# Altium schematic sheet SPARC_v3.SchDoc
size A4; SheetNumber: 1; SheetTotal: 1
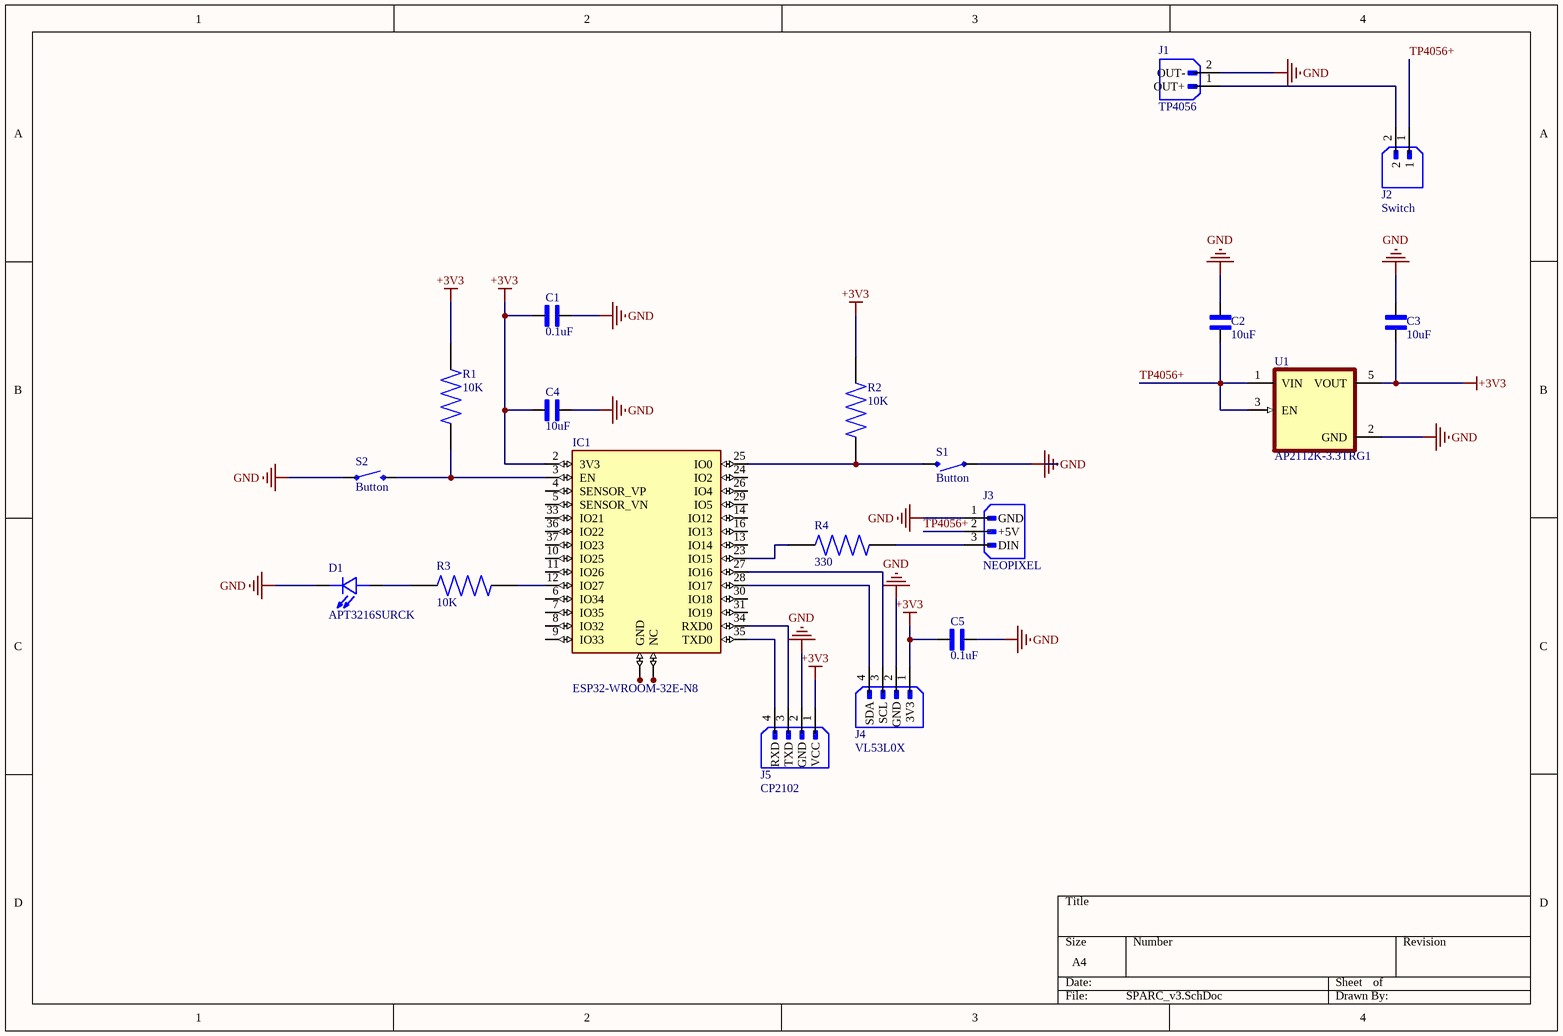
[diagram p0: SPARC_v3.SchDoc]

## Parts
C1  0.1uF  [CAPC3216X110N]
C2  10uF  [CAPC3216X110N]
C3  10uF  [CAPC3216X110N]
C4  10uF  [CAPC3216X110N]
C5  0.1uF  [CAPC3216X110N]
D1  APT3216SURCK  [LED_APT3216SURCK]
IC1  ESP32-WROOM-32E-N8  [ESP32WROOM32EN8]
J1  TP4056  [JST_B2B-XH-A]
J2  Switch  [JST_B2B-XH-A]
J3  NEOPIXEL  [JST_B3B-XH-A]
J4  VL53L0X  [JST_B4B-XH-A]
J5  CP2102  [JST_B4B-XH-A]
R1  10K  [RES_ERJP08D8251V]
R2  10K  [RES_ERJP08D8251V]
R3  10K  [RES_ERJP08D8251V]
R4  330  [RES_ERJP08D8251V]
S1  Button  [TACTILE_SWITCH_SMD_6.0X3.5MM]
S2  Button  [TACTILE_SWITCH_SMD_6.0X3.5MM]
U1  AP2112K-3.3TRG1  [SOT95P285X140-5N]

## Nets
+3V3: C1.2 C3.2 C4.2 C5.2 IC1.2(3V3) J4.1(3V3) J5.1(VCC) R1.2 R2.2 U1.5(VOUT)
GND: C1.1 C2.1 C3.1 C4.1 C5.1 D1.1(C) J1.2(OUT-) J3.1(GND) J4.2(GND) J5.2(GND) S1.1 S2.1 U1.2(GND)
TP4056+: C2.2 J2.1 J3.2(+5V) U1.1(VIN) U1.3(EN)
NetD1_2: D1.2(A) R3.1
NetIC1_1: IC1.1(GND) IC1.15(GND) IC1.38(GND) IC1.39(GND) IC1.40(GND) IC1.41(GND) IC1.42(GND) IC1.43(GND) IC1.44(GND) IC1.45(GND) IC1.46(GND) IC1.47(GND)
NetIC1_3: IC1.3(EN) R1.1 S2.2
NetIC1_12: IC1.12(IO27) R3.2
NetIC1_17: IC1.17(NC) IC1.18(NC) IC1.19(NC) IC1.20(NC) IC1.21(NC) IC1.22(NC) IC1.32(NC)
NetIC1_23: IC1.23(IO15) R4.1
NetIC1_25: IC1.25(IO0) R2.1 S1.2
NetIC1_27: IC1.27(IO16) J4.3(SCL)
NetIC1_28: IC1.28(IO17) J4.4(SDA)
NetIC1_34: IC1.34(RXD0) J5.3(TXD)
NetIC1_35: IC1.35(TXD0) J5.4(RXD)
NetJ1_1: J1.1(OUT+) J2.2
NetJ3_3: J3.3(DIN) R4.2

Not connected (* = marked no-connect by the designer): IC1 4(SENSOR_VP) 5(SENSOR_VN) 6(IO34) 7(IO35) 8(IO32) 9(IO33) 10(IO25) 11(IO26) 13(IO14) 14(IO12) 16(IO13) 24(IO2) 26(IO4) 29(IO5) 30(IO18) 31(IO19) 33(IO21) 36(IO22) 37(IO23)

## Library data of the parts
C1 C5 = 0.1uF: 1206 C 1uF Ceramic Multilayer Capacitor, 50 VDC, +125degC, X7R Dielec, +/-10% | KEMET C1206F105K5RACTU; SnapEDA_Link: https://www.snapeda.com/parts/C1206F105K5RACTU/Kemet/view-part/?ref=snap; Package: 1206 KEMET; Value: *; MF: KEMET; MP: C1206F105K5RACTU; Check_prices: https://www.snapeda.com/parts/C1206F105K5RACTU/Kemet/view-part/?ref=eda
C2-C4 = 10uF: 1206 C 1uF Ceramic Multilayer Capacitor, 50 VDC, +125degC, X7R Dielec, +/-10% | KEMET C1206F105K5RACTU; SnapEDA_Link: https://www.snapeda.com/parts/C1206F105K5RACTU/Kemet/view-part/?ref=snap; Package: 1206 KEMET; Value: *; MF: KEMET; MP: C1206F105K5RACTU; Check_prices: https://www.snapeda.com/parts/C1206F105K5RACTU/Kemet/view-part/?ref=eda
D1 = APT3216SURCK: Red 630nm LED Indication - Discrete 1.95V 1206 (3216 Metric); MF: Kingbright; SnapEDA_Link: https://www.snapeda.com/parts/APT3216SURCK/Kingbright/view-part/?ref=snap; Package: 1206 Kingbright; Value: *; MP: APT3216SURCK; Check_prices: https://www.snapeda.com/parts/APT3216SURCK/Kingbright/view-part/?ref=eda
IC1 = ESP32-WROOM-32E-N8: Bluetooth, WiFi 802.11b/g/n, Bluetooth v4.2 +EDR, Class 1, 2 and 3 Transceiver Module 2.4GHz ~ 2.5GHz PCB Trace Surface Mount; MF: Espressif Systems; SnapEDA_Link: https://www.snapeda.com/parts/ESP32-WROOM-32E-N8/Espressif+Systems/view-part/?ref=snap; Package: SMD-44 Espressif Systems; Value: *; MP: ESP32-WROOM-32E-N8; Check_prices: https://www.snapeda.com/parts/ESP32-WROOM-32E-N8/Espressif+Systems/view-part/?ref=eda
J1 = TP4056: MF: {'manufacturer': u'JST Sales America Inc.'}; MP: B2B-XH-A; Package: None; Price: None; Value: *; Availability: Unavailable
J2 = Switch: MF: {'manufacturer': u'JST Sales America Inc.'}; MP: B2B-XH-A; Package: None; Price: None; Value: *; Availability: Unavailable
J3 = B3B-XH-A: Connector Header Through Hole 3 position 0.098 (2.50mm); MF: JST Sales; SnapEDA_Link: https://www.snapeda.com/parts/B3B-XH-A/JST/view-part/?ref=snap; Package: None; Value: *; MP: B3B-XH-A; Check_prices: https://www.snapeda.com/parts/B3B-XH-A/JST/view-part/?ref=eda
J4 = VL53L0X: Connector Header Through Hole 4 position 0.098 (2.50mm); MF: JST Sales; MP: B4B-XH-A; SnapEDA_Link: https://www.snapeda.com/parts/B4B-XH-A/JST/view-part/?ref=snap; Package: None; Value: *; Check_prices: https://www.snapeda.com/parts/B4B-XH-A/JST/view-part/?ref=eda
J5 = CP2102: Connector Header Through Hole 4 position 0.098 (2.50mm); MF: JST Sales; MP: B4B-XH-A; SnapEDA_Link: https://www.snapeda.com/parts/B4B-XH-A/JST/view-part/?ref=snap; Package: None; Value: *; Check_prices: https://www.snapeda.com/parts/B4B-XH-A/JST/view-part/?ref=eda
R1-R3 = 10K R: MP: ERJP08D8251V; Package: None; Value: *; Price: None; Availability: Unavailable
R4 = 330 R: MP: ERJP08D8251V; Package: None; Value: *; Price: None; Availability: Unavailable
S1 S2 = PTS636SM25FSMTRLFS: Switch Tactile N.O. SPST Rectangular Button F-Lead 0.05A 12VDC 1.77N SMD T/R; MF: CK; SnapEDA_Link: https://www.snapeda.com/parts/PTS636SM25FSMTRLFS/C%2526K/view-part/?ref=snap; Package: None; Value: *; MP: PTS636SM25FSMTRLFS; Check_prices: https://www.snapeda.com/parts/PTS636SM25FSMTRLFS/C%2526K/view-part/?ref=eda
U1 = AP2112K-3.3TRG1: Linear Voltage Regulator IC Positive Fixed 1 Output 600mA SOT-25; MF: Diodes Inc.; Value: *; Purchase-URL: https://pricing.snapeda.com/search/part/AP2112K-3.3TRG1/?ref=eda; Package: SOT-753 Diodes Inc.; Availability: In Stock; Check_prices: https://www.snapeda.com/parts/AP2112K-3.3TRG1/Diodes+Inc./view-part/?ref=eda; Price: None; SnapEDA_Link: https://www.snapeda.com/parts/AP2112K-3.3TRG1/Diodes+Inc./view-part/?ref=snap; MP: AP2112K-3.3TRG1